# Altium schematic sheet 无线充电.SchDoc
size A4; SheetNumber: 1; SheetTotal: 1
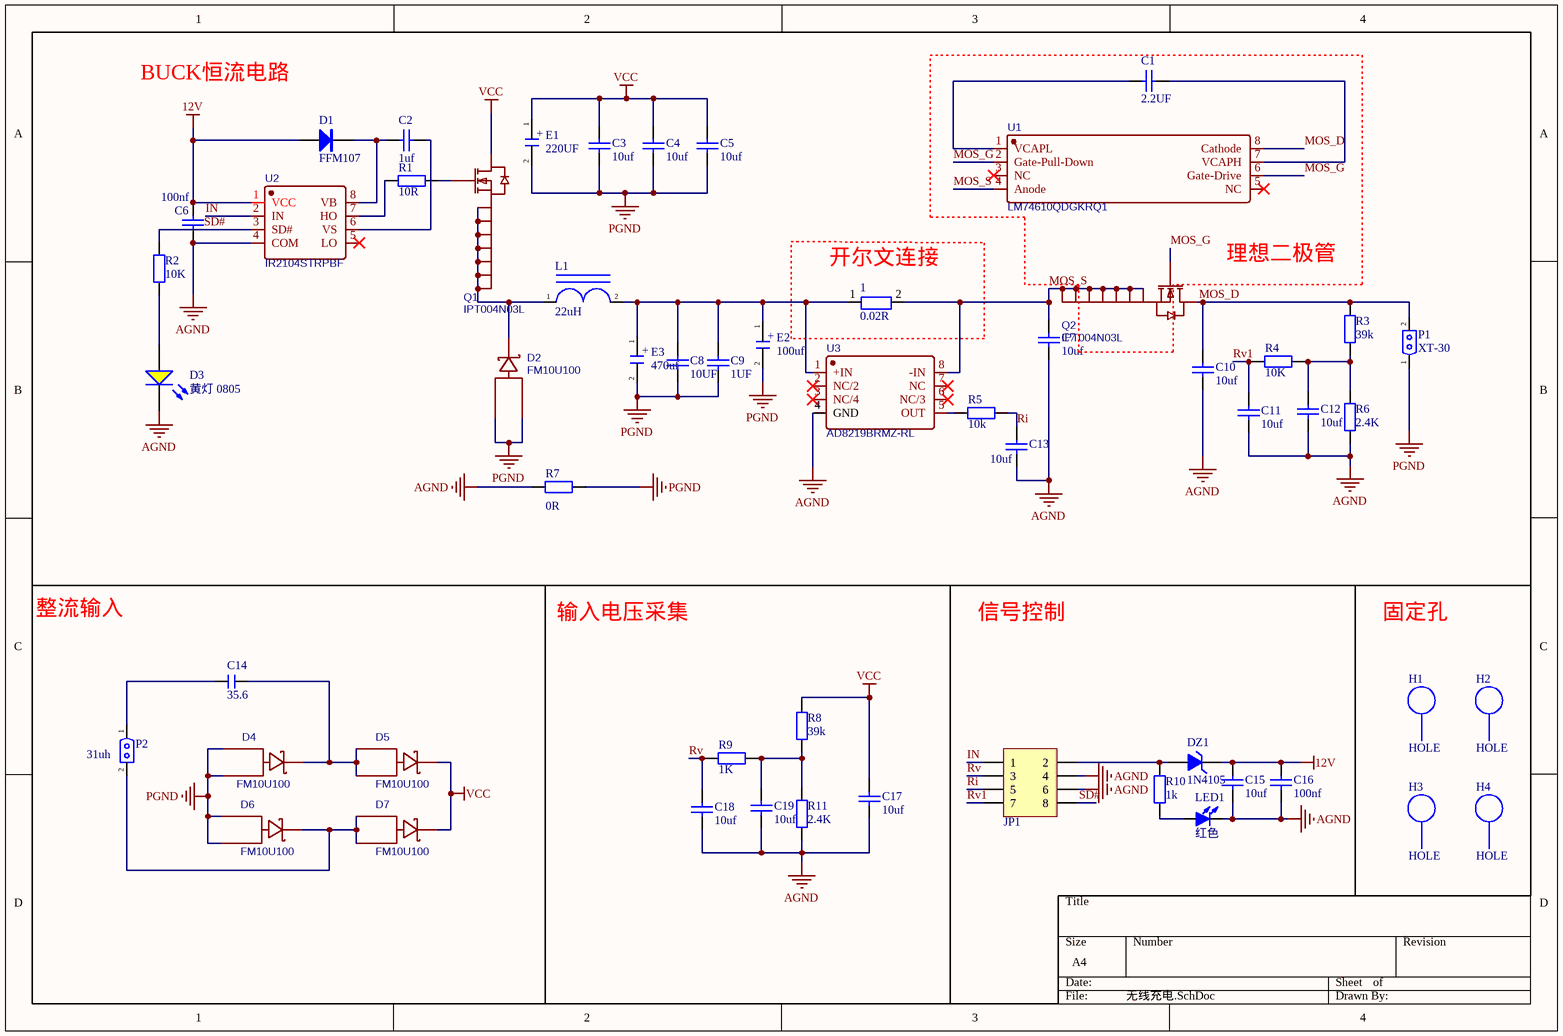
[diagram p0: 无线充电.SchDoc]

## Parts
1  0.02R  [R 2512_M]
C1  2.2UF  [0805_C]
C2  1uf  [0603_C]
C3  10uf  [0805_C]
C4  10uf  [0805_C]
C5  10uf  [0805_C]
C6  100nf  [0603_C]
C7  10uf  [0805_C]
C8  10UF  [0805_C]
C9  1UF  [0805_C]
C10  10uf  [0805_C]
C11  10uf  [0805_C]
C12  10uf  [0805_C]
C13  10uf  [0805_C]
C14  35.6  [C 1210_L]
C15  10uf  [0805_C]
C16  100nf  [0805_C]
C17  10uf  [0805_C]
C18  10uf  [0805_C]
C19  10uf  [0805_C]
D1  FFM107  [SOD-123]
D2  FM10U100  [TO-277B_3P-L6.1-W4.3-LS7.0-TR]
D3  黄灯 0805  [0805_LED_S1]
D4  FM10U100  [TO-277B_3P-L6.1-W4.3-LS7.0-TR]
D5  FM10U100  [TO-277B_3P-L6.1-W4.3-LS7.0-TR]
D6  FM10U100  [TO-277B_3P-L6.1-W4.3-LS7.0-TR]
D7  FM10U100  [TO-277B_3P-L6.1-W4.3-LS7.0-TR]
DZ1  1N4105  [SOD-123]
E1  220UF  [CM F(10*10.2)]
E2  100uf  [CM F(10*10.2)]
E3  470uf  [CAP 5.0*10*12.5]
H1  HOLE  [LQ_SCROW3&5MM]
H2  HOLE  [LQ_SCROW3&5MM]
H3  HOLE  [LQ_SCROW3&5MM]
H4  HOLE  [LQ_SCROW3&5MM]
JP1  Header 4X2  [CONN-TH_A2006WV-2X4P]  (value not drawn)
L1  22uH  [CDRH127]
LED1  红色  [LED 0805B]
P1  XT-30  [xt-30 - duplicate]
P2  31uh  [线圈]
Q1  IPT004N03L  [PG-HSOF-8-1_L10.4-W9.9-P1.2-LS11.7-TL]
Q2  IPT004N03L  [PG-HSOF-8-1_L10.4-W9.9-P1.2-LS11.7-TL]
R1  10R  [0603_R]
R2  10K  [0603_R]
R3  39k  [0805_R]
R4  10K  [0805_R]
R5  10k  [0805_R]
R6  2.4K  [0805_R]
R7  0R  [0805_R]
R8  39k  [0805_R]
R9  1K  [0805_R]
R10  1k  [0805_R]
R11  2.4K  [0805_R]
U1  LM74610QDGKRQ1  [VSSOP-8_L3.0-W3.0-P0.65-LS5.0-BL]
U2  IR2104STRPBF  [SOIC-8_L4.9-W3.9-P1.27-LS6.0-BL]
U3  AD8219BRMZ-RL  [MSOP-8_L3.0-W3.0-P0.65-LS4.9-BL]

## Blocks framed on the sheet
BUCK恒流电路: C2-C13 D1-D3 E1-E3 L1 P1 Q1 R1-R7 U2 U3
理想二极管: C1 Q2 U1
开尔文连接: 1

## Nets
12V: C6.2 C15.1 C16.2 D1.1(A) DZ1.2(K) U2.1(VCC)
AGND: C6.1 C7.1 C10.1 C11.1 C12.1 C13.1 C15.2 C16.1 C17.1 C18.1 C19.1 D3.K JP1.4 JP1.6 LED1.2(K) R6.1 R7.2 R11.1 U2.4(COM) U3.4(GND)
PGND: C3.1 C4.1 C5.1 C8.1 C9.1 D2.1(A) D2.3(A) D4.1(A) D4.3(A) D6.1(A) D6.3(A) E1.2 E2.2 E3.2 P1.1 R7.1
VCC: C3.2 C4.2 C5.2 C17.2 D5.2(C) D7.2(C) E1.1 Q1.9(D) R8.2
IN: JP1.1 U2.2(IN)
MOS_D: C10.2 P1.2 Q2.9(D) R3.2 U1.8(Cathode)
MOS_G: Q2.1(G) U1.2(Gate-Pull-Down) U1.6(Gate-Drive)
MOS_S: 1.2 C7.2 Q2.2(S) Q2.3(S) Q2.4(S) Q2.5(S) Q2.6(S) Q2.7(S) Q2.8(S) U1.4(Anode) U3.8(-IN)
Ri: C13.2 JP1.5 R5.2
Rv: C18.2 JP1.3 R9.2
Rv1: C11.2 JP1.7 R4.2
SD#: JP1.8 R2.2 U2.3(SD#)
Net1_1: 1.1 C8.2 C9.2 E2.1 E3.1 L1.2 U3.1(+IN)
NetC1_1: C1.1 U1.7(VCAPH)
NetC1_2: C1.2 U1.1(VCAPL)
NetC2_1: C2.1 D1.2(K) U2.8(VB)
NetC2_2: C2.2 U2.6(VS)
NetC12_2: C12.2 R3.1 R4.1 R6.2
NetC14_1: C14.1 P2.1
NetC14_2: C14.2 D4.2(C) D5.1(A) D5.3(A)
NetC19_2: C19.2 R8.1 R9.1 R11.2
NetD2_2: D2.2(C) L1.1 Q1.2(S) Q1.3(S) Q1.4(S) Q1.5(S) Q1.6(S) Q1.7(S) Q1.8(S)
NetD3_A: D3.A R2.1
NetD6_2: D6.2(C) D7.1(A) D7.3(A) P2.2
NetDZ1_1: DZ1.1(A) JP1.2 R10.2
NetLED1_1: LED1.1(A) R10.1
NetQ1_1: Q1.1(G) R1.2
NetR1_1: R1.1 U2.7(HO)
NetR5_1: R5.1 U3.5(OUT)

Not connected (* = marked no-connect by the designer): U1 3(NC)* 5(NC)*; U2 5(LO)*; U3 2(NC/2)* 3(NC/4)* 6(NC/3)* 7(NC)*

## Notes on the sheet
- 整流输入
- 输入电压采集
- 信号控制
- 固定孔
- (in symbol C-CM) +

## Library data of the parts
1 = 2512
C1 C3-C5 C7-C13 C17-C19 = 0805 10nF (103) 10% 50V: 贴片电容; ComponentLink1Description: 供应商链接; ComponentLink1URL: http://www.szlcsc.com/product/details_2062.html; Package: 0805; Supplier: LC; SuppliersPartNumber: C1710
C2 C6 = 0603 1.0pF (010) 0.25pF 50V: 贴片电容; ComponentLink1Description: 供应商链接; ComponentLink1URL: http://www.szlcsc.com/product/details_24709.html; Package: 0603; Supplier: LC; SuppliersPartNumber: C23969
C14 = C: 无极性贴片电容; 版权归属: 源创客; 材质: X7R; BOM名称: 无极性贴片电容; 学习资源: www.ooocke.com
C15 C16 = 0805 1.0pF (010) 0.25pF 50V: 贴片电容; ComponentLink1Description: 供应商链接; ComponentLink1URL: http://www.szlcsc.com/product/details_15644.html; Package: 0805; Supplier: LC; SuppliersPartNumber: C14971
D1 = FR107w: 快恢复整流二极管; BOM名称: 快恢复二极管; 版权归属: 源创客; 学习资源: www.ooocke.com
D2 D4-D7 = FM10U100: BOM_Manufacturer: Formosa Microsemi; Contributor: LCSC; BOM_Supplier: LCSC; BOM_Supplier Part: C376165; BOM_Manufacturer Part: FM10U100; BOM_JLCPCB Part Class: Extended Part; spicePre: D; spiceSymbolName: FM10U100
D3 = 0805 黄灯: 发光二极管; ComponentLink1Description: 供应商链接; ComponentLink1URL: http://www.szlcsc.com/product/details_2669.html; Package: 0805; Supplier: LC; SuppliersPartNumber: C2296
DZ1 = 1N4105: 11V/0.5W稳压管; 版权归属: 源创客; BOM名称: 11V/0.5W稳压管; 学习资源: www.ooocke.com
E1-E3 = C-CM: 贴片电解电容; 版权归属: 源创客; BOM名称: 贴片电解电容; 学习资源: www.ooocke.com
H1-H4 = HOLE: 固定孔
JP1 = Header 4X2: 4*2P接插件; 版权归属: 源创客; BOM名称: 4*2P接插件; 学习资源: www.ooocke.com
L1 = L: 一体化成型电感
LED1 = LED-5MM: 0805LED; BOM名称: 5mm插件LED; 版权归属: 源创客; 学习资源: www.ooocke.com
P1 = XT-30_1: 接口
P2 = 线圈: 接口
Q1 Q2 = IPT004N03L: BOM_Manufacturer: Infineon Technologies; Contributor: LCSC; BOM_Supplier: LCSC; BOM_Supplier Part: C531197; BOM_Manufacturer Part: IPT004N03L; BOM_JLCPCB Part Class: Extended Part; spicePre: Q; spiceSymbolName: IPT004N03L
R1 R2 = 0603 0Ω (0R0) 1%: 贴片电阻; ComponentLink1Description: 供应商链接; ComponentLink1URL: http://www.szlcsc.com/product/details_21903.html; Package: 0603; Supplier: LC; SuppliersPartNumber: C21189
R3-R11 = 0805 10MΩ (1005) 1%: 贴片电阻; ComponentLink1Description: 供应商链接; ComponentLink1URL: http://www.szlcsc.com/product/details_26851.html; Package: 0805; Supplier: LC; SuppliersPartNumber: C26108
U1 = LM74610QDGKRQ1: BOM_Manufacturer: TI(德州仪器); Contributor: lcsc; BOM_Supplier: LCSC; BOM_Supplier Part: C2649431; BOM_Manufacturer Part: LM74610QDGKRQ1; link: https://atta.szlcsc.comnull; spicePre: U; spiceSymbolName: LM74610QDGKRQ1
U2 = IR2104STRPBF: BOM_Manufacturer: IR; spicePre: X; BOM_Supplier: LCSC; BOM_Manufacturer Part: IR2104STRPBF; BOM_Supplier Part: C2960; BOM_JLCPCB Part Class: Extended Part; spiceSymbolName: IR2104STRPBF
U3 = AD8217BRMZ-RL: BOM_Manufacturer: Analog Devices; Contributor: LCSC; BOM_Supplier: LCSC; BOM_Supplier Part: C652512; BOM_Manufacturer Part: AD8217BRMZ-RL; BOM_JLCPCB Part Class: Extended Part; spicePre: U; spiceSymbolName: AD8217BRMZ-RL